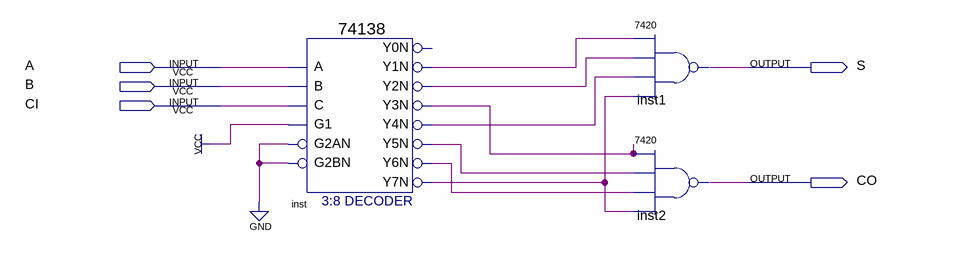
[diagram p0: schematic sheet]
// Quartus schematic 74138_test2.bdf as structural Verilog: 3 symbols, 5 pins
module \74138_test2  (
  input  A,
  input  B,
  input  CI,
  output S,
  output CO
);

  wire inst_y1n, inst_y2n, inst_y3n, inst_y4n, inst_y5n, inst_y6n, inst_y7n;

  \74138  inst (
    .A(A), .B(B), .G1(1'b1), .C(CI), .G2AN(1'b0), .G2BN(1'b0), .Y1N(inst_y1n), .Y2N(inst_y2n),
    .Y3N(inst_y3n), .Y4N(inst_y4n), .Y5N(inst_y5n), .Y6N(inst_y6n), .Y7N(inst_y7n));  // open: Y0N
  \7420  inst1 (.\4 (inst_y4n), .\2 (inst_y1n), .\3 (inst_y2n), .\5 (inst_y7n), .\1 (S));
  \7420  inst2 (.\4 (inst_y6n), .\2 (inst_y3n), .\3 (inst_y5n), .\5 (inst_y7n), .\1 (CO));
endmodule
